# Altium schematic sheet CAN-1.SchDoc
size A4
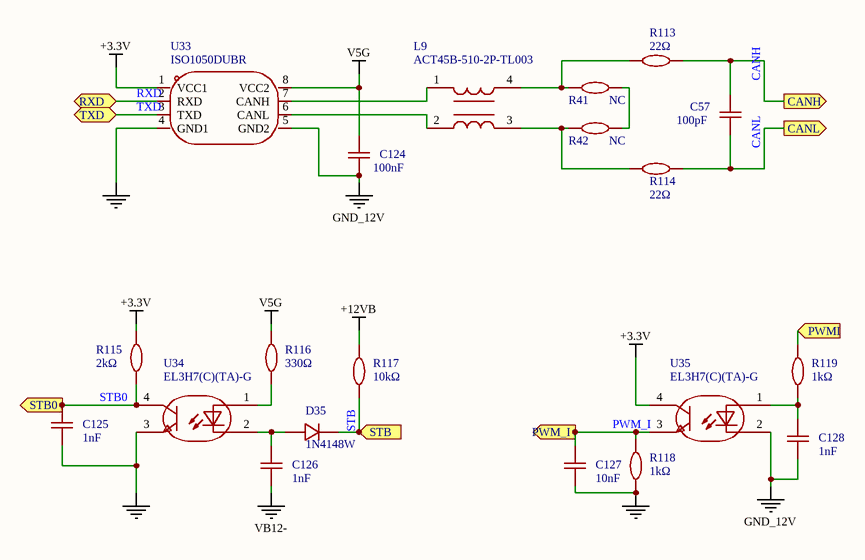
[diagram p0: CAN-1.SchDoc]

## Parts
C57  100pF  [C0603]
C124  100nF  [C0603]
C125  1nF  [C0603]
C126  1nF  [C0603]
C127  10nF  [C0603]
C128  1nF  [C0603]
D35  1N4148W  [SOD-123_L2.8-W1.8-LS3.7-RD]
L9  ACT45B-510-2P-TL003  [IND-SMD_4P-L4.5-W3.2-TL]
R41  NC  [R0603]
R42  NC  [R0603]
R113  22Ω  [R0603]
R114  22Ω  [R0603]
R115  2kΩ  [R0603]
R116  330Ω  [R0603]
R117  10kΩ  [R0603]
R118  1kΩ  [R0603]
R119  1kΩ  [R0603]
U33  ISO1050DUBR  [SOIC-8_L9.3-W6.6-P2.54-LS10.4-BL]
U34  EL3H7(C)(TA)-G  [SMD-4_L2.7-W4.4-P1.27-LS7.0-BL]
U35  EL3H7(C)(TA)-G  [SMD-4_L2.7-W4.4-P1.27-LS7.0-BL]

## Ports
CANH (out), CANL (out), PWM_I (out), PWMI (in), RXD (bidir), STB0 (out), STB (in), TXD (bidir)

## Nets
+3.3V: R115.2 U33.1(VCC1) U35.4
+12VB: R117.1
GND: C125.1 C127.1 R118.1 U33.4(GND1) U34.3
GND_12V: C124.2 C128.1 U33.5(GND2) U35.2
V5G: C124.1 R116.2 U33.8(VCC2)
VB12-: C126.1
CANH: C57.2 R113.2 ; port CANH
CANL: C57.1 R114.2 ; port CANL
PWM_I: C127.2 R118.2 U35.3 ; port PWM_I
PWMI: R119.2 ; port PWMI
RXD: U33.2(RXD) ; port RXD
STB: D35.1(K) R117.2 ; port STB
STB0: C125.2 R115.1 U34.4 ; port STB0
TXD: U33.3(TXD) ; port TXD
NetC126_2: C126.2 D35.2(A) U34.2
NetC128_2: C128.2 R119.1 U35.1
NetL9_1: L9.1 U33.7(CANH)
NetL9_2: L9.2 U33.6(CANL)
NetL9_3: L9.3 R42.1 R114.1
NetL9_4: L9.4 R41.1 R113.1
NetR41_2: R41.2 R42.2
NetR116_1: R116.1 U34.1

## Library data of the parts
C57 = CC0603KRX7R9BB101: 容值:100pF;精度:±10%;额定电压:50V;材质(温度系数):X7R;; Manufacturer: YAGEO(国巨); Add into BOM: yes; Tolerance: ±10%; Voltage Rated: 50V; Temperature Coefficient: X7R; Symbol: CC0603KRX7R9BB101; Device: CC0603KRX7R9BB101; Supplier: LCSC; Supplier Part: C160903; Manufacturer Part: CC0603KRX7R9BB101; Value: 100pF; JLCPCB Part Class: 扩展库; LCSC Part Name: 100pF ±10% 50V; Supplier Footprint: 0603; Datasheet: https://atta.szlcsc.com/upload/public/pdf/source/20180910/C282072_33301C7F631E79921B82A8DAC6BCC5B3.pdf; Convert to PCB: yes; Comment_1: 100pF
C124 = 0603B104K500NT: 容值:100nF;精度:±10%;额定电压:50V;材质(温度系数):X7R;; Manufacturer: FH(风华); Add into BOM: yes; Tolerance: ±10%; Voltage Rated: 50V; Temperature Coefficient: X7R; Symbol: 0603B104K500NT; Device: 0603B104K500NT; Supplier: LCSC; Manufacturer Part: 0603B104K500NT; Value: 100nF; Supplier Part: C30926; JLCPCB Part Class: 扩展库; LCSC Part Name: 100nF ±10% 50V; Supplier Footprint: 0603; Datasheet: https://atta.szlcsc.com/upload/public/pdf/source/20200305/C486355_26A10D38EF8C2A5C37091D0039909270.pdf; Convert to PCB: yes; Comment_1: 100nF
C125 C126 C128 = CC0603KRX7R9BB102: 容值:1nF;精度:±10%;额定电压:50V;材质(温度系数):X7R;; Manufacturer: YAGEO(国巨); Add into BOM: yes; Tolerance: ±10%; Voltage Rated: 50V; Temperature Coefficient: X7R; Symbol: CC0603KRX7R9BB102; Device: CC0603KRX7R9BB102; Supplier: LCSC; Manufacturer Part: CC0603KRX7R9BB102; Value: 1nF; Supplier Part: C100040; JLCPCB Part Class: 扩展库; LCSC Part Name: 1nF ±10% 50V; Supplier Footprint: 0603; Datasheet: https://atta.szlcsc.com/upload/public/pdf/source/20180910/C282072_33301C7F631E79921B82A8DAC6BCC5B3.pdf; Convert to PCB: yes; Comment_1: 1nF
C127 = CC0603KRX7R9BB103: 容值:10nF;精度:±10%;额定电压:50V;材质(温度系数):X7R;; Manufacturer: YAGEO(国巨); Add into BOM: yes; Tolerance: ±10%; Voltage Rated: 50V; Temperature Coefficient: X7R; Symbol: CC0603KRX7R9BB103; Device: CC0603KRX7R9BB103; Supplier: LCSC; Manufacturer Part: CC0603KRX7R9BB103; Value: 10nF; Supplier Part: C100042; JLCPCB Part Class: 扩展库; LCSC Part Name: 10nF ±10% 50V; Supplier Footprint: 0603; Datasheet: https://atta.szlcsc.com/upload/public/pdf/source/20181008/C309510_22F155564471FAF6A489F7D68F34234E.pdf; Convert to PCB: yes; Comment_1: 10nF
D35 = 1N4148W_C2099: 二极管配置:独立式;正向压降(Vf):1.25V@150mA;直流反向耐压(Vr):100V;平均整流电流(Io):150mA;功率:500mW;反向恢复时间(trr):4ns;; Manufacturer: CJ(江苏长电/长晶); Symbol: 1N4148W T4; Add into BOM: yes; Diode Configuration: 独立式; Reverse Voltage (Vr): 100V; Average Rectified Current (Io): 150mA; Power Dissipation: 500mW; Reverse Leakage Current: 1uA@75V; Reverse Recovery Time (trr): 4ns; Device: 1N4148W_C2099; Supplier: LCSC; Manufacturer Part: 1N4148W; Supplier Part: C2099; JLCPCB Part Class: 扩展库; LCSC Part Name: 电压:100V 电流:150mA; Supplier Footprint: SOD-123; Datasheet: https://atta.szlcsc.com/upload/public/pdf/source/20120428/1457706480199.pdf; Convert to PCB: yes; Forward Voltage (Vf@If): 1.25V@150mA; Operating Temperature: -; Comment_1: 1N4148W
L9 = ACT45B-510-2P-TL003: 线路数:2;电感 @ 频率:51uH@100kHz;阻抗 @ 频率:2.8kΩ@10MHz;直流电阻(DCR):1Ω;; Manufacturer: TDK; Add into BOM: yes; Number of Lines: 2; Withstanding Voltage: 250V@2Secs; Current Rating: 200mA; Voltage Rating - DC: 50V; DC Resistance (DCR): 1Ω; Symbol: ACT45B-510-2P-TL003; Device: ACT45B-510-2P-TL003; Supplier: LCSC; Manufacturer Part: ACT45B-510-2P-TL003; Supplier Part: C76584; JLCPCB Part Class: 扩展库; LCSC Part Name: 两路 4532共模滤波器 阻抗2.8kΩ@10MHz; Supplier Footprint: SMD,4.5x3.2mm; Datasheet: https://atta.szlcsc.com/upload/public/pdf/source/20160918/1474166842057.pdf; Convert to PCB: yes; Inductance @ Frequency: 51uH@100kHz; Impedance @ Frequency: 2.8kΩ@10MHz; Operating Temperature: -40℃~+150℃; Comment_1: ACT45B-510-2P-TL003
R41 R42 R117 = 0603WAF1002T5E: 电阻类型:厚膜电阻;阻值:10kΩ;精度:±1%;功率:100mW;最大工作电压:75V;温度系数:±100ppm/℃;; Manufacturer: UNI-ROYAL(厚声); Add into BOM: yes; Tolerance: ±1%; Power(Watts): 100mW; Overload Voltage (Max): 75V; Symbol: 0603WAF1002T5E; Device: 0603WAF1002T5E; Supplier: LCSC; Manufacturer Part: 0603WAF1002T5E; Supplier Part: C25804; JLCPCB Part Class: 基础库; LCSC Part Name: 厚膜电阻 10kΩ ±1% 100mW; Supplier Footprint: 0603; Datasheet: https://atta.szlcsc.com/upload/public/pdf/source/20200306/C422600_1E6D84923E4A46A82E41ADD87F860B5C.pdf; Convert to PCB: yes; Type: 厚膜电阻; Temperature Coefficient: ±100ppm/℃; Operating Temperature Range: -55℃~+155℃
  R41 R42: Value: NC; Comment_1: NC
  R117: Value: 10kΩ; Comment_1: 10kΩ
R113 R114 = 0603WAF220JT5E: 电阻类型:厚膜电阻;阻值:22Ω;精度:±1%;功率:100mW;最大工作电压:75V;温度系数:±100ppm/℃;; Manufacturer: UNI-ROYAL(厚声); Add into BOM: yes; Tolerance: ±1%; Power(Watts): 100mW; Overload Voltage (Max): 75V; Symbol: 0603WAF220JT5E; Device: 0603WAF220JT5E; Supplier: LCSC; Manufacturer Part: 0603WAF220JT5E; Supplier Part: C23345; Value: 22Ω; JLCPCB Part Class: 基础库; LCSC Part Name: 22Ω ±1% 100mW 厚膜电阻; Supplier Footprint: 0603; Datasheet: https://atta.szlcsc.com/upload/public/pdf/source/20200306/C422600_1E6D84923E4A46A82E41ADD87F860B5C.pdf; Convert to PCB: yes; Type: 厚膜电阻; Temperature Coefficient: ±100ppm/℃; Operating Temperature Range: -55℃~+155℃; Comment_1: 22Ω
R115 = 0603WAF2001T5E: 电阻类型:厚膜电阻;阻值:2kΩ;精度:±1%;功率:100mW;最大工作电压:75V;温度系数:±100ppm/℃;; Manufacturer: UNI-ROYAL(厚声); Add into BOM: yes; Tolerance: ±1%; Power(Watts): 100mW; Overload Voltage (Max): 75V; Symbol: 0603WAF2001T5E; Device: 0603WAF2001T5E; Supplier: LCSC; Manufacturer Part: 0603WAF2001T5E; Supplier Part: C22975; Value: 2kΩ; JLCPCB Part Class: 基础库; LCSC Part Name: 2kΩ ±1% 100mW 厚膜电阻; Supplier Footprint: 0603; Datasheet: https://atta.szlcsc.com/upload/public/pdf/source/20200306/C422600_1E6D84923E4A46A82E41ADD87F860B5C.pdf; Convert to PCB: yes; Type: 厚膜电阻; Temperature Coefficient: ±100ppm/℃; Operating Temperature Range: -55℃~+155℃; Comment_1: 2kΩ
R116 = 0603WAF3300T5E: 电阻类型:厚膜电阻;阻值:330Ω;精度:±1%;功率:100mW;最大工作电压:75V;温度系数:±100ppm/℃;; Manufacturer: UNI-ROYAL(厚声); Add into BOM: yes; Tolerance: ±1%; Power(Watts): 100mW; Overload Voltage (Max): 75V; Symbol: 0603WAF3300T5E; Device: 0603WAF3300T5E; Supplier: LCSC; Manufacturer Part: 0603WAF3300T5E; Supplier Part: C23138; Value: 330Ω; JLCPCB Part Class: 基础库; LCSC Part Name: 330Ω ±1% 100mW 厚膜电阻; Supplier Footprint: 0603; Datasheet: https://atta.szlcsc.com/upload/public/pdf/source/20200306/C422600_1E6D84923E4A46A82E41ADD87F860B5C.pdf; Convert to PCB: yes; Type: 厚膜电阻; Temperature Coefficient: ±100ppm/℃; Operating Temperature Range: -55℃~+155℃; Comment_1: 330Ω
R118 R119 = RC0603FR-071KL: 电阻类型:厚膜电阻;阻值:1kΩ;精度:±1%;功率:100mW;最大工作电压:75V;温度系数:±100ppm/℃;; Manufacturer: YAGEO(国巨); Add into BOM: yes; Tolerance: ±1%; Power(Watts): 100mW; Overload Voltage (Max): 75V; Symbol: RC0603FR-071KL; Device: RC0603FR-071KL; LCSC Part Name: 厚膜电阻 1kΩ ±1% 100mW; Supplier Part: C22548; Manufacturer Part: RC0603FR-071KL; Supplier Footprint: 0603; JLCPCB Part Class: 扩展库; Datasheet: https://atta.szlcsc.com/upload/public/pdf/source/20180316/70C0E2BDAE7FCC62C531A5A58D202EE1.pdf; Supplier: LCSC; Convert to PCB: yes; Type: 厚膜电阻; Value: 1kΩ; Temperature Coefficient: ±100ppm/℃; Operating Temperature Range: -55℃~+155℃; Comment_1: 1kΩ
U33 = ISO1050DUBR: 类型:收发器；隔离器;数据速率:1Mbps;; Manufacturer: TI(德州仪器); Add into BOM: yes; Data Rate: 1Mbps; Supply Voltage: 3V~5.5V; Symbol: ISO1050DUBR; Device: ISO1050DUBR; LCSC Part Name: 1Mbps 3V~5.5V; Supplier Part: C16428; Manufacturer Part: ISO1050DUBR; Supplier Footprint: SOP-8; JLCPCB Part Class: 扩展库; Datasheet: https://www.ti.com/cn/lit/gpn/iso1050; Supplier: LCSC; Convert to PCB: yes; Type: 收发器；隔离器; Operating Temperature: -55℃~+105℃; Comment_1: ISO1050DUBR
U34 U35 = EL3H7(C)(TA)-G: 输入电压类型:DC;正向电压:1.2V;输出电流:50mA;隔离电压(rms):3.75kV;反向电压:6V;接收端电压:80V;输出通道数:1;集射极饱和电压(Vce(sat)@Ic,IF):100mV@1mA,10mA;; Manufacturer: EVERLIGHT(亿光); Add into BOM: yes; Input voltage type: DC; Output Type: 光电三极管; Forward Voltage: 1.2V; Output Current: 50mA; Isolation Voltage(rms): 3.75kV; Reverse Voltage: 6V; Receiving End Voltage: 80V; Number of Outputs: 1; Rise time: 5us@2mA,100Ω; Fall time: 3us@2mA,100Ω; Symbol: EL3H7(C)(TA)-G; Device: EL3H7(C)(TA)-G; Supplier: LCSC; Manufacturer Part: EL3H7(C)(TA)-G; Supplier Part: C92243; JLCPCB Part Class: 扩展库; LCSC Part Name: DC输入 隔离电压(rms):3750V; Supplier Footprint: SOIC-4-175mil; Datasheet: https://atta.szlcsc.com/upload/public/pdf/source/20180207/C181879_15179899084781356541.pdf; Convert to PCB: yes; Collector-Emitter Saturation Voltage (Vce(sat)@Ic,IF): 100mV@1mA,10mA; Operating Temperature: -55℃~+110℃; Comment_1: EL3H7(C)(TA)-G